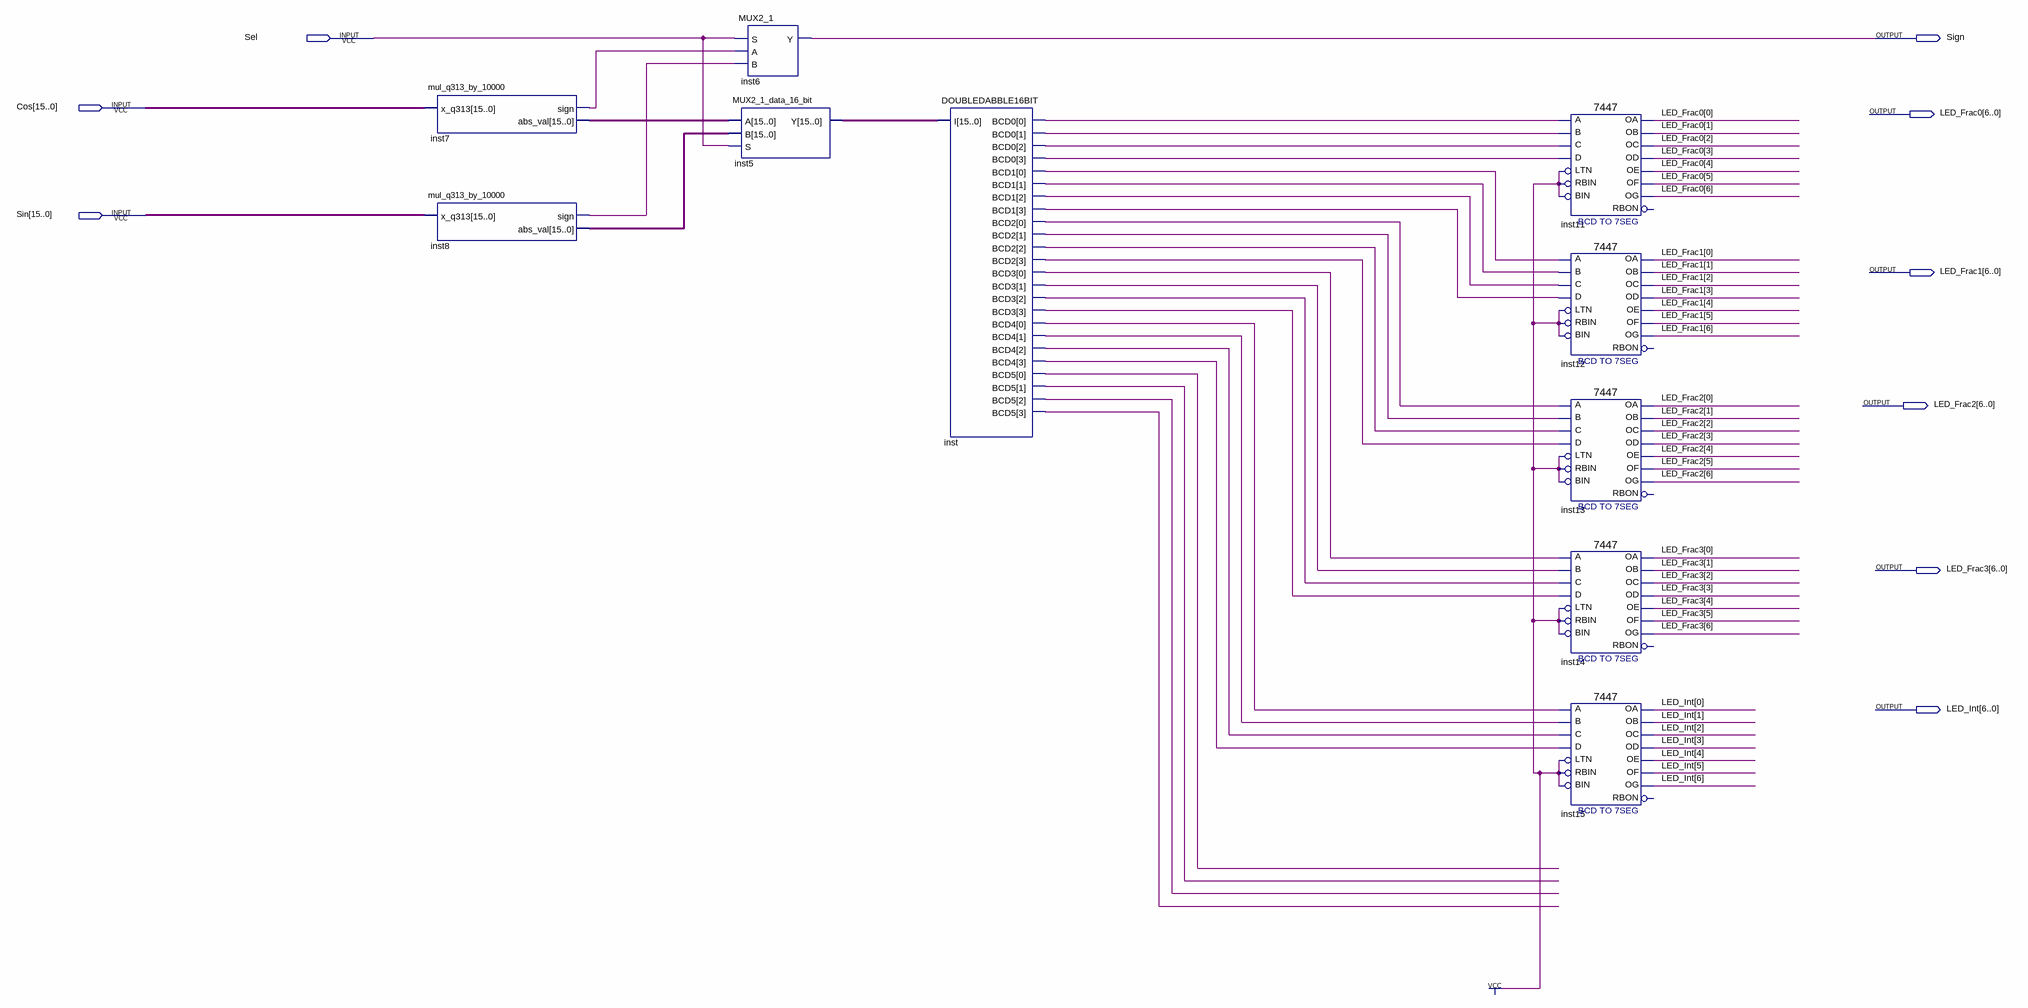
[diagram p0: schematic sheet]
// Quartus schematic Output_to_7_seg.bdf as structural Verilog: 10 symbols, 9 pins
module Output_to_7_seg (
  input  Sel,
  input  [15:0] Cos,
  input  [15:0] Sin,
  output Sign,
  output [6:0] LED_Frac0,
  output [6:0] LED_Frac1,
  output [6:0] LED_Frac2,
  output [6:0] LED_Frac3,
  output [6:0] LED_Int
);

  wire inst7_sign, inst8_sign, inst_bcd0, inst_bcd0_2, inst_bcd0_3, inst_bcd0_4, inst_bcd1, inst_bcd1_2,
       inst_bcd1_3, inst_bcd1_4, inst_bcd2, inst_bcd2_2, inst_bcd2_3, inst_bcd2_4, inst_bcd3, inst_bcd3_2,
       inst_bcd3_3, inst_bcd3_4, inst_bcd4, inst_bcd4_2, inst_bcd4_3, inst_bcd4_4, inst_bcd5, inst_bcd5_2,
       inst_bcd5_3, inst_bcd5_4;
  wire [15:0] inst5_y, inst7_abs_val, inst8_abs_val;

  mul_q313_by_10000 inst7 (.x_q313(Cos), .sign(inst7_sign), .abs_val(inst7_abs_val));
  mul_q313_by_10000 inst8 (.x_q313(Sin), .sign(inst8_sign), .abs_val(inst8_abs_val));
  MUX2_1 inst6 (.S(Sel), .A(inst7_sign), .B(inst8_sign), .Y(Sign));
  MUX2_1_data_16_bit inst5 (.A(inst7_abs_val), .B(inst8_abs_val), .S(Sel), .Y(inst5_y));
  DOUBLEDABBLE16BIT inst (
    .I(inst5_y), .BCD0({inst_bcd0_3, inst_bcd0_2, inst_bcd0, inst_bcd0_4}),
    .BCD1({inst_bcd1_3, inst_bcd1_2, inst_bcd1, inst_bcd1_4}),
    .BCD2({inst_bcd2_4, inst_bcd2_3, inst_bcd2_2, inst_bcd2}),
    .BCD3({inst_bcd3_4, inst_bcd3_3, inst_bcd3_2, inst_bcd3}),
    .BCD4({inst_bcd4_4, inst_bcd4_3, inst_bcd4_2, inst_bcd4}),
    .BCD5({inst_bcd5_4, inst_bcd5_3, inst_bcd5_2, inst_bcd5}));
  \7447  inst11 (
    .LTN(1'b1), .B(inst_bcd0), .C(inst_bcd0_2), .D(inst_bcd0_3), .RBIN(1'b1), .BIN(1'b1), .A(inst_bcd0_4),
    .OB(LED_Frac0[1]), .OC(LED_Frac0[2]), .OE(LED_Frac0[4]), .OD(LED_Frac0[3]), .OF(LED_Frac0[5]),
    .OG(LED_Frac0[6]), .OA(LED_Frac0[0]));  // open: RBON
  \7447  inst12 (
    .LTN(1'b1), .B(inst_bcd1), .C(inst_bcd1_2), .D(inst_bcd1_3), .RBIN(1'b1), .BIN(1'b1), .A(inst_bcd1_4),
    .OB(LED_Frac1[1]), .OC(LED_Frac1[2]), .OE(LED_Frac1[4]), .OD(LED_Frac1[3]), .OF(LED_Frac1[5]),
    .OG(LED_Frac1[6]), .OA(LED_Frac1[0]));  // open: RBON
  \7447  inst13 (
    .LTN(1'b1), .B(inst_bcd2_2), .C(inst_bcd2_3), .D(inst_bcd2_4), .RBIN(1'b1), .BIN(1'b1), .A(inst_bcd2),
    .OB(LED_Frac2[1]), .OC(LED_Frac2[2]), .OE(LED_Frac2[4]), .OD(LED_Frac2[3]), .OF(LED_Frac2[5]),
    .OG(LED_Frac2[6]), .OA(LED_Frac2[0]));  // open: RBON
  \7447  inst14 (
    .LTN(1'b1), .B(inst_bcd3_2), .C(inst_bcd3_3), .D(inst_bcd3_4), .RBIN(1'b1), .BIN(1'b1), .A(inst_bcd3),
    .OB(LED_Frac3[1]), .OC(LED_Frac3[2]), .OE(LED_Frac3[4]), .OD(LED_Frac3[3]), .OF(LED_Frac3[5]),
    .OG(LED_Frac3[6]), .OA(LED_Frac3[0]));  // open: RBON
  \7447  inst15 (
    .LTN(1'b1), .B(inst_bcd4_2), .C(inst_bcd4_3), .D(inst_bcd4_4), .RBIN(1'b1), .BIN(1'b1), .A(inst_bcd4),
    .OB(LED_Int[1]), .OC(LED_Int[2]), .OE(LED_Int[4]), .OD(LED_Int[3]), .OF(LED_Int[5]), .OG(LED_Int[6]),
    .OA(LED_Int[0]));  // open: RBON
endmodule
